# EasyEDA Pro project iamdt-guang-chui-60-40a2c53b.epro, board PCB1_2
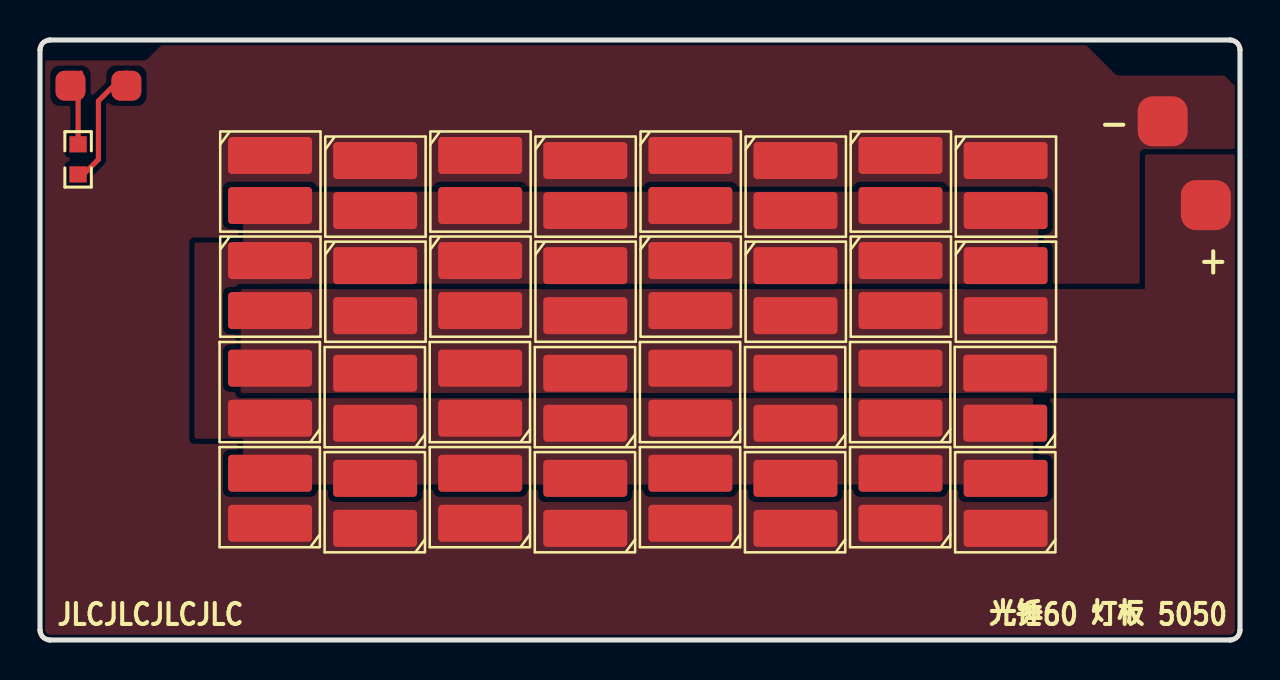
[diagram p5: board, top side]
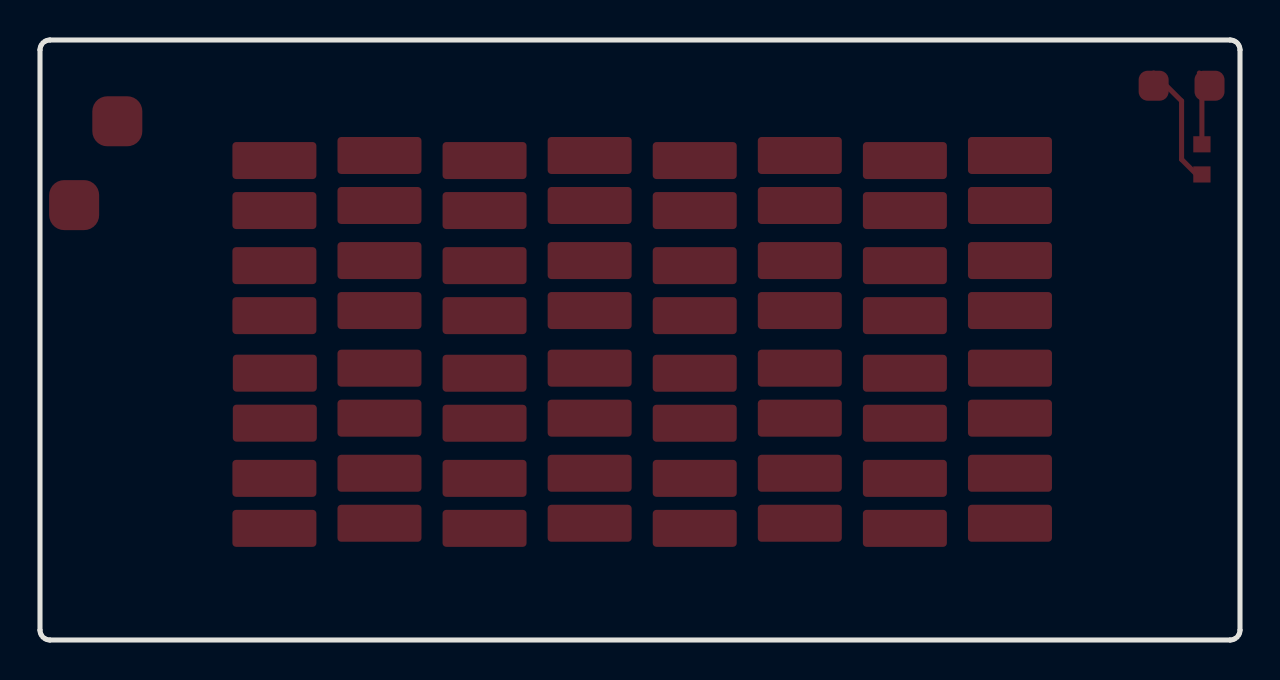
[diagram p6: board, bottom side, seen from below]

Outline 60 x 30 mm; copper layers: Top Layer, Bottom Layer. Coordinates in mm from the lower left corner of the outline.
Outline path: 0,29.5 0,0.5 arc(0.15,0.15) 0.5,0 59.5,0 arc(59.85,0.15) 60,0.5 60,29.5 arc(59.85,29.85) 59.5,30 0.5,30 arc(0.15,29.85) 0,29.5
Stack: Top Layer 0.035mm / Dielectric1 1.51mm FR4 er 4.5 / Bottom Layer 0.035mm

## Design rules (mm)
spacing copperThickness1oz (default): track to track 0.102, other pairs 0.152 to 0.3
spacing copperThickness2oz: track to track 0.203, other pairs 0.152 to 0.3
spacing Plane_innerPlane: track to track 0.102, other pairs 0.152 to 0.3
spacing Copper_copperRegion: track to track 0.102, other pairs 0.152 to 0.3
track width copperThickness1oz (default): min 0.127, default 0.254, max 2.54
track width copperThickness2oz: min 0.203, default 0.254, max 2.54
differential pair differentialPair (default): width min 0.127, default 0.254, max 2.54; gap min 0.152, default 0.152
pour e12 uses Copper_copperRegion
pour e14 uses Copper_copperRegion
pour e16 uses Copper_copperRegion
pour e18 uses Copper_copperRegion
pour e20 uses Copper_copperRegion
pour e22 uses Copper_copperRegion
pour e24 uses Copper_copperRegion

## Placement (name value [footprint] x y rotation side)
LED1  SAW9L60A  [emc5050-1]  48.28 6.83 270 top
LED2  SAW9L60A  [emc5050-1]  43.03 7.09 270 top
LED3  SAW9L60A  [emc5050-1]  37.77 6.83 270 top
LED4  SAW9L60A  [emc5050-1]  32.52 7.09 270 top
LED5  SAW9L60A  [emc5050-1]  27.26 6.83 270 top
LED6  SAW9L60A  [emc5050-1]  22.01 7.09 270 top
LED7  SAW9L60A  [emc5050-1]  16.76 6.83 270 top
LED8  SAW9L60A  [emc5050-1]  11.5 7.09 270 top
LED9  SAW9L60A  [emc5050-1]  48.26 12.09 270 top
LED10  SAW9L60A  [emc5050-1]  43.03 12.34 270 top
LED11  SAW9L60A  [emc5050-1]  37.77 12.09 270 top
LED12  SAW9L60A  [emc5050-1]  32.52 12.34 270 top
LED13  SAW9L60A  [emc5050-1]  27.26 12.09 270 top
LED14  SAW9L60A  [emc5050-1]  22.01 12.34 270 top
LED15  SAW9L60A  [emc5050-1]  16.76 12.09 270 top
LED16  SAW9L60A  [emc5050-1]  11.5 12.34 270 top
LED17  SAW9L60A  [emc5050-1]  48.28 17.47 90 top
LED18  SAW9L60A  [emc5050-1]  43.03 17.72 90 top
LED19  SAW9L60A  [emc5050-1]  37.77 17.47 90 top
LED20  SAW9L60A  [emc5050-1]  32.52 17.72 90 top
LED21  SAW9L60A  [emc5050-1]  27.26 17.47 90 top
LED22  SAW9L60A  [emc5050-1]  22.01 17.72 90 top
LED23  SAW9L60A  [emc5050-1]  16.76 17.47 90 top
LED24  SAW9L60A  [emc5050-1]  11.5 17.72 90 top
LED25  SAW9L60A  [emc5050-1]  48.28 22.72 90 top
LED26  SAW9L60A  [emc5050-1]  43.03 22.98 90 top
LED27  SAW9L60A  [emc5050-1]  37.77 22.72 90 top
LED28  SAW9L60A  [emc5050-1]  32.52 22.98 90 top
LED29  SAW9L60A  [emc5050-1]  27.26 22.72 90 top
LED30  SAW9L60A  [emc5050-1]  22.01 22.98 90 top
LED31  SAW9L60A  [emc5050-1]  16.76 22.72 90 top
LED32  SAW9L60A  [emc5050-1]  11.5 22.98 90 top
NOREF  -  [Pad_e3]  4.32 27.71 0 top
NOREF#2  -  [Pad_e2]  58.29 21.75 0 top
NOREF#3  -  [Pad_e1]  56.13 25.94 0 top
NOREF#4  -  [Pad_e4]  1.52 27.71 0 top
R1  SDNT1608X103F3435FTF  [R0603]  1.91 24.03 270 top

## Footprints (pads in the part's own frame, mm; a bottom-side part is the same pattern mirrored in y, then rotated)
emc5050-1
  rrect 1.85x4.2 smd: 1(-1.25,0) 2(1.25,0)
Pad_e1
  rrect 2.5x2.5 smd: 1(0,0)
Pad_e2
  rrect 2.5x2.5 smd: 1(0,0)
Pad_e3
  rrect 1.5x1.5 smd: 1(0,0)
Pad_e4
  rrect 1.5x1.5 smd: 1(0,0)
R0603
  rect 0.806x0.864 smd: 1(-0.753,0) 2(0.753,0)

## Nets
GND: LED1.2 LED2.2 LED3.2 LED4.2 LED5.2 LED6.2 LED7.2 LED8.2 LED25.2 LED26.2 LED27.2 LED28.2 LED29.2 LED30.2 LED31.2 LED32.2 NOREF#3.1
VCC: LED9.1 LED10.1 LED11.1 LED12.1 LED13.1 LED14.1 LED15.1 LED16.1 LED17.1 LED18.1 LED19.1 LED20.1 LED21.1 LED22.1 LED23.1 LED24.1 NOREF#2.1
NET1: NOREF#4.1 R1.1
NET2: NOREF.1 R1.2
$1N4818: LED1.1 LED2.1 LED3.1 LED4.1 LED5.1 LED6.1 LED7.1 LED8.1 LED9.2 LED10.2 LED11.2 LED12.2 LED13.2 LED14.2 LED15.2 LED16.2 LED17.2 LED18.2 LED19.2 LED20.2 LED21.2 LED22.2 LED23.2 LED24.2 LED25.1 LED26.1 LED27.1 LED28.1 LED29.1 LED30.1 LED31.1 LED32.1

## Routing (per net, layer and track width the routed paths; a pad name or vN(x,y) marks a point on that pad's centre or on a via; arc(x,y) is an arc through that point)
NET1: length 3.6
  Top Layer w0.254: 2.03,28.35 1.91,28.22 R1.1
NET2: length 6.5
  Top Layer w0.254: 1.65,23.28 2.17,23.28 2.92,24.03 2.92,26.95 4.32,28.35

## Copper pours and planes (outline as drawn; the poured copper is in the pictures)
GND on Top Layer: -1.14,31.27 61.21,31.27 61.21,-0.73 -1.14,-0.73
VCC on Top Layer: 10.03,17.55 57.28,17.55 57.28,12.35 10.03,12.35
VCC on Top Layer: 55.25,24.28 60.45,24.28 60.45,12.35 55.25,12.35
$1N4818 on Top Layer: 10.16,22.41 49.91,22.41 49.91,17.71 10.16,17.71
$1N4818 on Top Layer: 10.16,12.09 49.53,12.09 49.53,7.78 10.16,7.78
$1N4818 on Top Layer: 7.72,19.87 11.68,19.87 11.68,10.06 7.72,10.06
$1N4818 on Top Layer: 10.29,12.22 49.66,12.22 49.66,7.9 10.29,7.9

## Text on the board
Top Silkscreen Layer: JLCJLCJLCJLC | - | + | 光锤60 灯板 5050
